# Altium schematic sheet Connectors.SchDoc
size A4; SheetNumber: 5; SheetTotal: 5
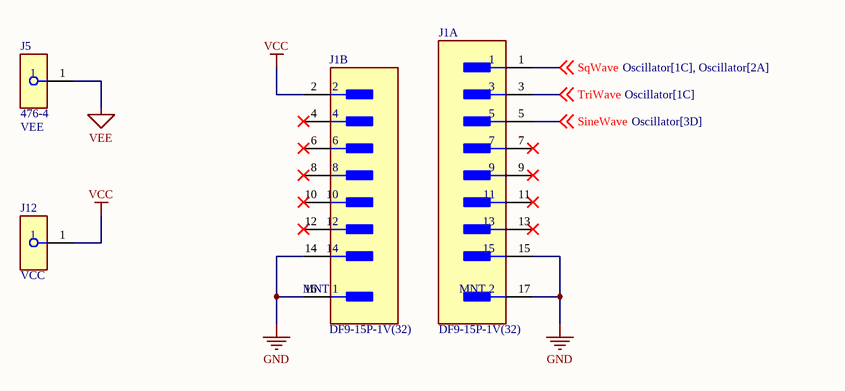
[diagram p0: Connectors.SchDoc]

## Parts
J1  DF9-15P-1V(32)  [FP-DF9-15P-1V_32-MFG]  (parts A,B of 2)
J5  476-4  [FP-476-4-MFG]
J12  (no value)  [FP-476-4-MFG]

## Nets
GND: J1.14 J1.15 J1.16(MNT_1) J1.17(MNT_2)
VCC: J1.2 J12.1
VEE: J5.1
SineWave: J1.5 ; off-sheet SineWave
SqWave: J1.1 ; off-sheet SqWave
TriWave: J1.3 ; off-sheet TriWave

Not connected (* = marked no-connect by the designer): J1 4* 6* 7* 8* 9* 10* 11* 12* 13*

## Notes on the sheet
- (near J5) VEE
- (near J12) VCC

## Library data of the parts
J1 = CMP-11605-000052-1: CONN HDR 15POS SMD TIN; Number of Positions: 15; Pitch: 1mm; Voltage Rating: 150V; Gender: Male; Current Rating: 500mA; Mated Stacking Heights: 4.3mm; Orientation: Straight; Lead Free: Lead Free; Housing Color: Beige; Contact Plating: Tin; Number of Rows: 2; Package Quantity: 1; Housing Material: Polyamide; Number of Contacts: 15; Termination: SMD/SMT; Mount: Surface Mount; Contact Material: Copper; Flammability Rating: UL94 V-0; Packaging: Tape and Reel; Radiation Hardening: No
J5 = CMP-19636-000003-1: PLUG JACK MINI NON-INSULATED; Manufacturer: Keystone Electronics; Is Female: yes; Number Of Contacts: 1; Current Rating: 10A; Conn Orientation: Straight; Device Class L1: Connectors; Category: Conn; ComponentLink2Description: Datasheet; Lead Free: Yes; Device Class L3: unset; Package: 476-4; RoHS: TRUE; Contact Material: Tin; Footprint Url: https://www.keyelco.com/product-pdf.cfm?p=2378; Mouser Description: Test Plugs & Test Jacks BANANA JACK NON-INSUL; Octopart: https://octopart.com/476-4-keystone-225161; Device Class L2: unset; Manufacturer Part Number: 476-4; ComponentLink2URL: https://www.keyelco.com/userAssets/file/M65p111.pdf; Digikey Description: PLUG JACK MINI NON-INSULATED; Automotive: No
J12 = CMP-19636-000003-1: PLUG JACK MINI NON-INSULATED; Manufacturer: Keystone Electronics; Manufacturer Part Number: 476-4; Is Female: yes; Number Of Contacts: 1; Current Rating: 10A; Conn Orientation: Straight; Device Class L1: Connectors; Category: Conn; ComponentLink2Description: Datasheet; Lead Free: Yes; Device Class L3: unset; Package: 476-4; RoHS: TRUE; Contact Material: Tin; Footprint Url: https://www.keyelco.com/product-pdf.cfm?p=2378; Mouser Description: Test Plugs & Test Jacks BANANA JACK NON-INSUL; Octopart: https://octopart.com/476-4-keystone-225161; Device Class L2: unset; ComponentLink2URL: https://www.keyelco.com/userAssets/file/M65p111.pdf; Digikey Description: PLUG JACK MINI NON-INSULATED; Automotive: No